# Altium schematic sheet Sheet1.SchDoc
size E; SheetNumber: 1; SheetTotal: 2
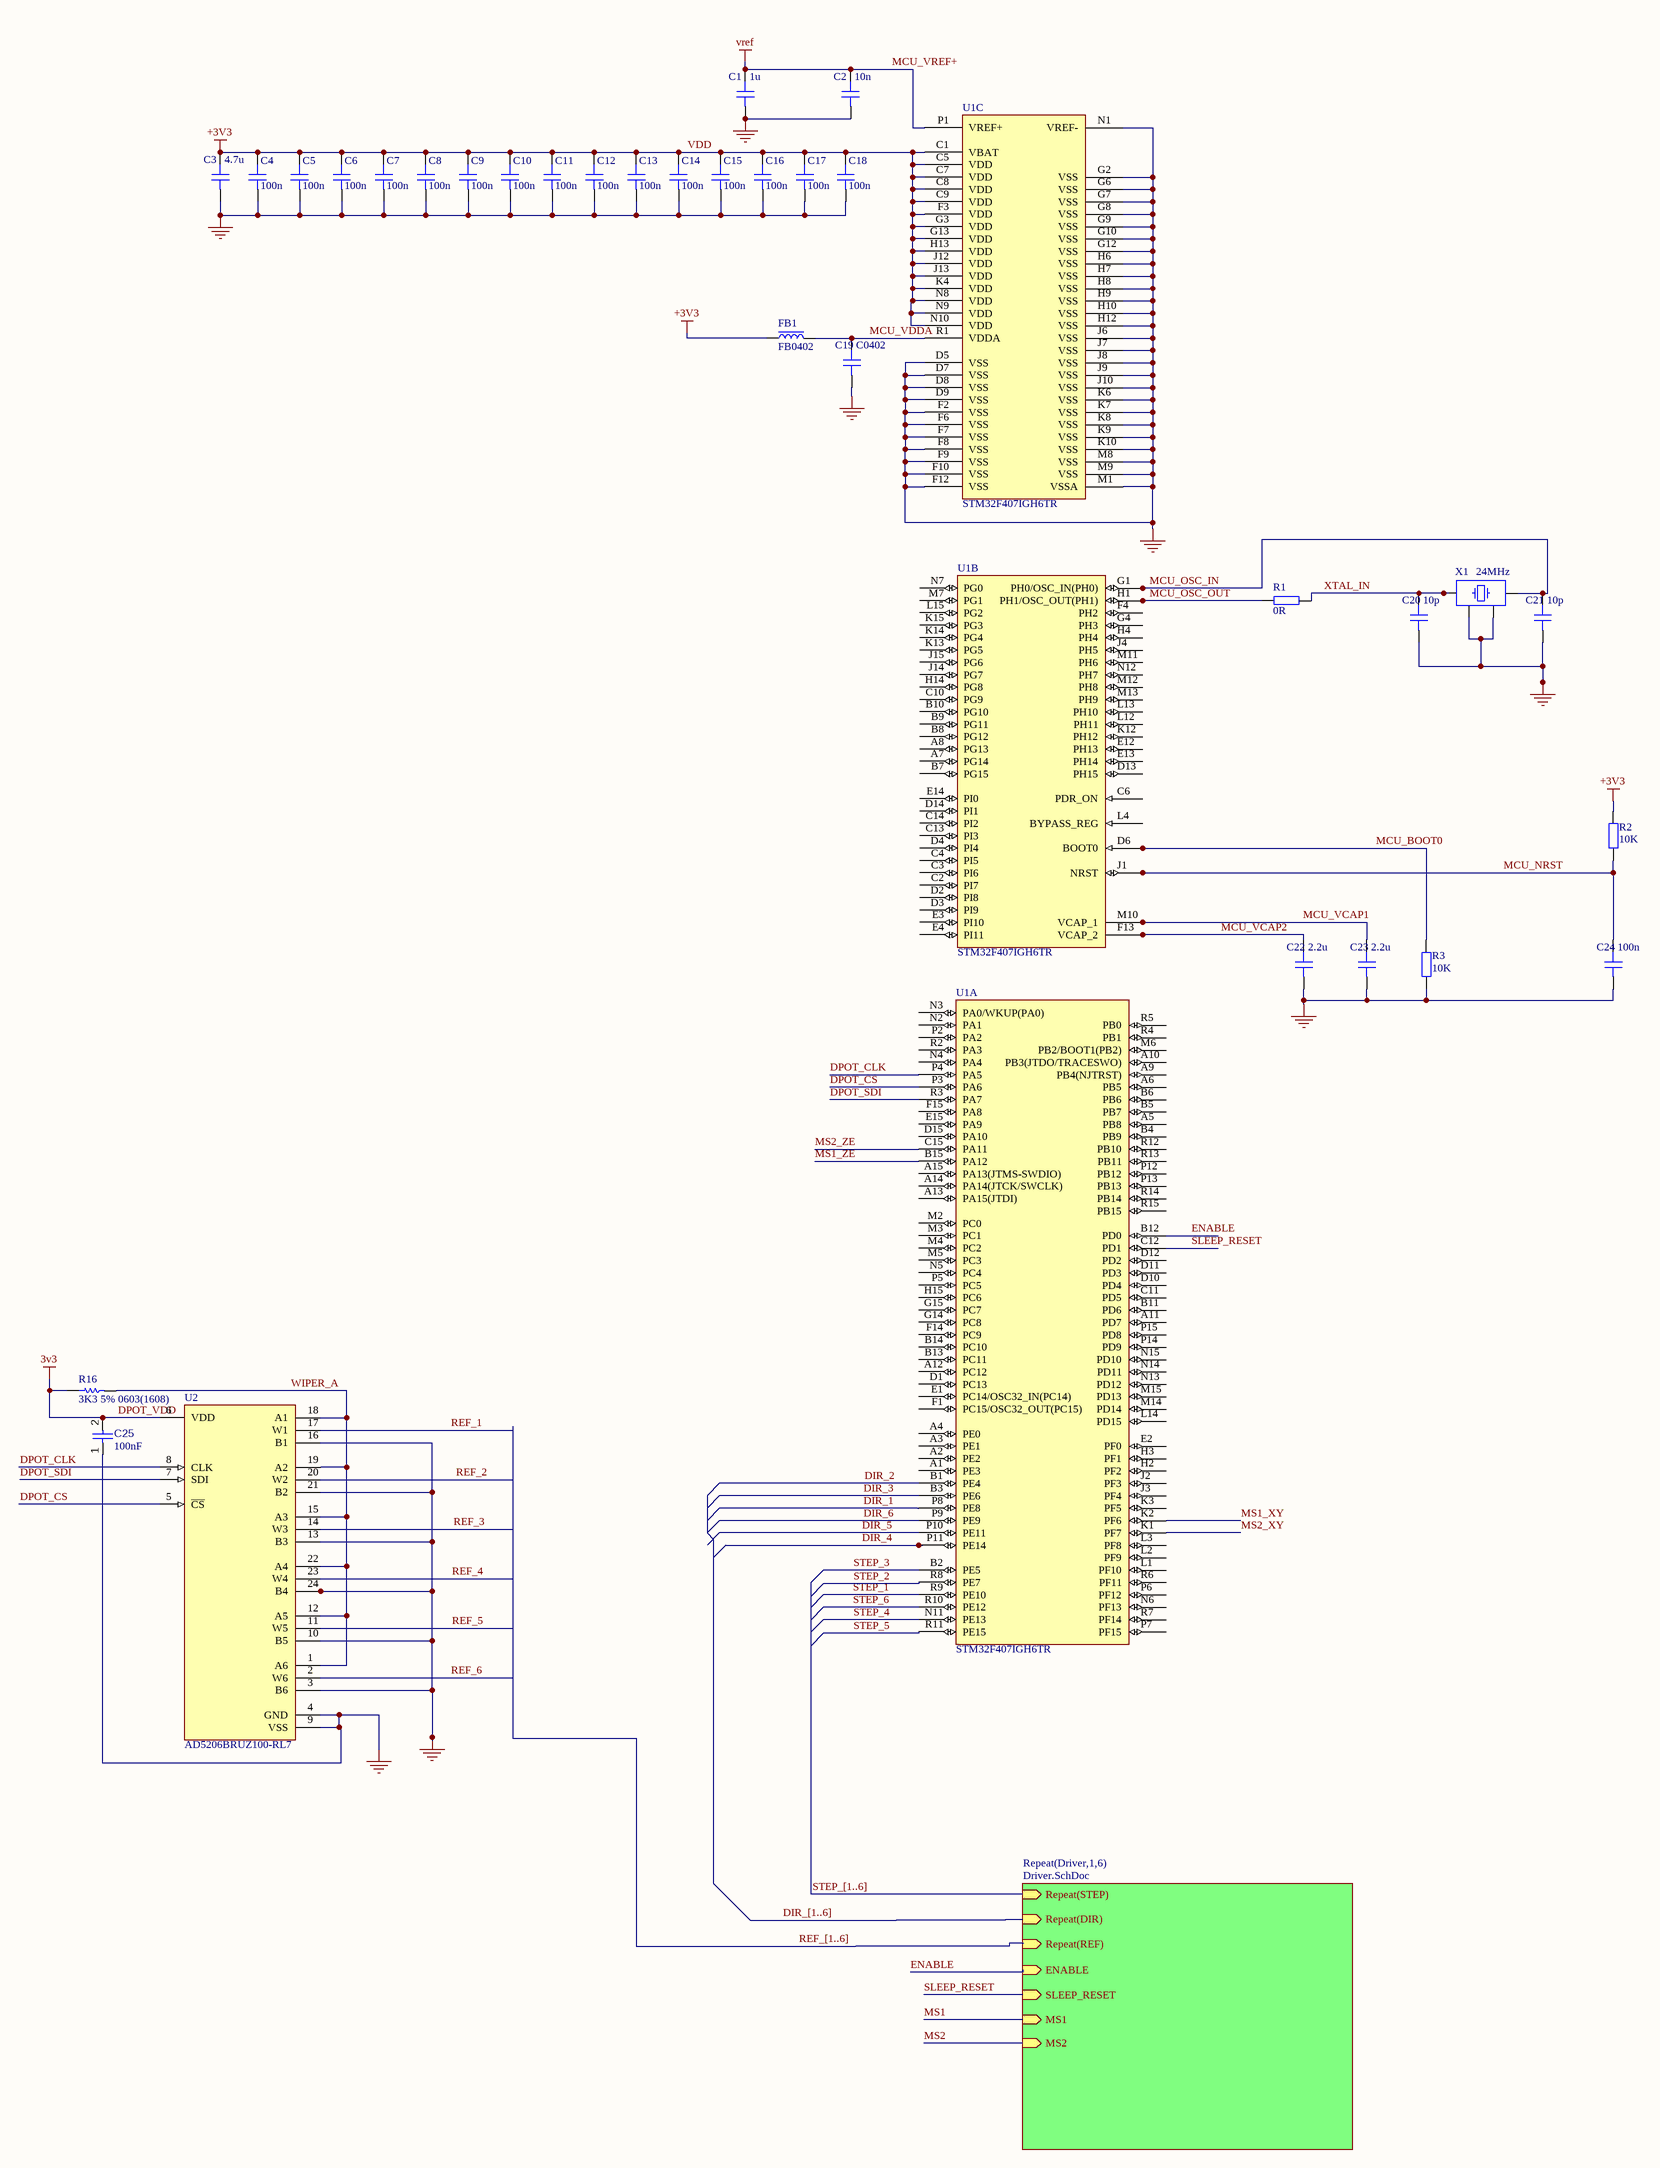
[diagram p0: Sheet1.SchDoc]

## Parts
C1  1u  [CAP_0402]
C2  10n  [CAP_0402]
C3  4.7u  [CAP_0402]
C4  100n  [CAP_0402]
C5  100n  [CAP_0402]
C6  100n  [CAP_0402]
C7  100n  [CAP_0402]
C8  100n  [CAP_0402]
C9  100n  [CAP_0402]
C10  100n  [CAP_0402]
C11  100n  [CAP_0402]
C12  100n  [CAP_0402]
C13  100n  [CAP_0402]
C14  100n  [CAP_0402]
C15  100n  [CAP_0402]
C16  100n  [CAP_0402]
C17  100n  [CAP_0402]
C18  100n  [CAP_0402]
C19  C0402  [CAP_0402]
C20  10p  [CAP_0402]
C21  10p  [CAP_0402]
C22  2.2u  [CAP_0402]
C23  2.2u  [CAP_0402]
C24  100n  [CAP_0402]
C25  value 100nF  [CAPC1608X90X40NL10T20]  (hidden comment: Capacitor 100 nF +/-10% 50 V 0603)
FB1  FB0402  [FB_0402]
R1  0R  [RES_0402]
R2  10K  [RES_0402]
R3  10K  [RES_0402]
R16  3K3 5% 0603(1608)  [RESC0603(1608)_N]
U1  STM32F407IGH6TR  [STM-UFBGA176+25_A_V]  (parts A,B,C of 3)
U2  AD5206BRUZ100-RL7  [FP-RU-24-IPC_C]
X1  24MHz  [XTAL_3225]

## Sub-sheets
Repeat(Driver,1,6) = Driver.SchDoc: ENABLE (in), SLEEP_RESET (in), MS1 (in), MS2 (in), Repeat(REF) (in), Repeat(DIR) (in), Repeat(STEP) (in)

## Nets
DPOT_VDD: C25.2 R16.1 U2.6(VDD)  [also labelled 3v3]
GND: C1.1 C2.1 C3.1 C4.1 C5.1 C6.1 C7.1 C8.1 C9.1 C10.1 C11.1 C12.1 C13.1 C14.1 C15.1 C16.1 C17.1 C18.1 C19.1 C20.1 C21.1 C22.1 C23.1 C24.1 C25.1 R3.2 U1.D5(VSS) U1.D7(VSS) U1.D8(VSS) U1.D9(VSS) U1.F2(VSS) U1.F6(VSS) U1.F7(VSS) U1.F8(VSS) U1.F9(VSS) U1.F10(VSS) U1.F12(VSS) U1.G2(VSS) U1.G6(VSS) U1.G7(VSS) U1.G8(VSS) U1.G9(VSS) U1.G10(VSS) U1.G12(VSS) U1.H6(VSS) U1.H7(VSS) U1.H8(VSS) U1.H9(VSS) U1.H10(VSS) U1.H12(VSS) U1.J6(VSS) U1.J7(VSS) U1.J8(VSS) U1.J9(VSS) U1.J10(VSS) U1.K6(VSS) U1.K7(VSS) U1.K8(VSS) U1.K9(VSS) U1.K10(VSS) U1.M1(VSSA) U1.M8(VSS) U1.M9(VSS) U1.N1(VREF-) U2.3(B6) U2.4(GND) U2.9(VSS) U2.10(B5) U2.13(B3) U2.16(B1) U2.21(B2) U2.24(B4) X1.2 X1.4
MCU_VREF+: C1.2 C2.2 U1.P1(VREF+)  [also labelled vref]
VDD: C3.2 C4.2 C5.2 C6.2 C7.2 C8.2 C9.2 C10.2 C11.2 C12.2 C13.2 C14.2 C15.2 C16.2 C17.2 C18.2 FB1.1 R2.1 U1.C1(VBAT) U1.C5(VDD) U1.C7(VDD) U1.C8(VDD) U1.C9(VDD) U1.F3(VDD) U1.G3(VDD) U1.G13(VDD) U1.H13(VDD) U1.J12(VDD) U1.J13(VDD) U1.K4(VDD) U1.N8(VDD) U1.N9(VDD) U1.N10(VDD)  [also labelled +3V3]
DIR_1: U1.P8(PE8)
DIR_2: U1.B1(PE4)
DIR_3: U1.B3(PE6)
DIR_4: U1.P11(PE14)
DIR_5: U1.P10(PE11)
DIR_6: U1.P9(PE9)
DPOT_CLK: U1.P4(PA5) U2.8(CLK)
DPOT_CS: U1.P3(PA6) U2.5(~{CS})
DPOT_SDI: U1.R3(PA7) U2.7(SDI)
ENABLE: U1.B12(PD0) ; sheet Repeat(Driver,1,6)/ENABLE
MCU_BOOT0: R3.1 U1.D6(BOOT0)
MCU_NRST: C24.2 R2.2 U1.J1(NRST)
MCU_OSC_IN: C21.2 U1.G1(PH0/OSC_IN(PH0)) X1.3
MCU_OSC_OUT: R1.2 U1.H1(PH1/OSC_OUT(PH1))
MCU_VCAP1: C23.2 U1.M10(VCAP_1)
MCU_VCAP2: C22.2 U1.F13(VCAP_2)
MCU_VDDA: C19.2 FB1.2 U1.R1(VDDA)
MS1: sheet Repeat(Driver,1,6)/MS1
MS1_XY: U1.K2(PF6)
MS1_ZE: U1.B15(PA12)
MS2: sheet Repeat(Driver,1,6)/MS2
MS2_XY: U1.K1(PF7)
MS2_ZE: U1.C15(PA11)
REF_1: U2.17(W1)
REF_2: U2.20(W2)
REF_3: U2.14(W3)
REF_4: U2.23(W4)
REF_5: U2.11(W5)
REF_6: U2.2(W6)
SLEEP_RESET: U1.C12(PD1) ; sheet Repeat(Driver,1,6)/SLEEP_RESET
STEP_1: U1.R9(PE10)
STEP_2: U1.R8(PE7)
STEP_3: U1.B2(PE5)
STEP_4: U1.N11(PE13)
STEP_5: U1.R11(PE15)
STEP_6: U1.R10(PE12)
WIPER_A: R16.2 U2.1(A6) U2.12(A5) U2.15(A3) U2.18(A1) U2.19(A2) U2.22(A4)
XTAL_IN: C20.2 R1.1 X1.1

Not connected (* = marked no-connect by the designer): U1 A1(PE3) A2(PE2) A3(PE1) A4(PE0) A5(PB8) A6(PB5) A7(PG14) A8(PG13) A9(PB4(NJTRST)) A10(PB3(JTDO/TRACESWO)) A11(PD7) A12(PC12) A13(PA15(JTDI)) A14(PA14(JTCK/SWCLK)) A15(PA13(JTMS-SWDIO)) B4(PB9) B5(PB7) B6(PB6) B7(PG15) B8(PG12) B9(PG11) B10(PG10) B11(PD6) B13(PC11) B14(PC10) C2(PI7) C3(PI6) C4(PI5) C6(PDR_ON) C10(PG9) C11(PD5) C13(PI3) C14(PI2) D1(PC13) D2(PI8) D3(PI9) D4(PI4) D10(PD4) D11(PD3) D12(PD2) D13(PH15) D14(PI1) D15(PA10) E1(PC14/OSC32_IN(PC14)) E2(PF0) E3(PI10) E4(PI11) E12(PH13) E13(PH14) E14(PI0) E15(PA9) F1(PC15/OSC32_OUT(PC15)) F4(PH2) F14(PC9) F15(PA8) G4(PH3) G14(PC8) G15(PC7) H2(PF2) H3(PF1) H4(PH4) H14(PG8) H15(PC6) J2(PF3) J3(PF4) J4(PH5) J14(PG7) J15(PG6) K3(PF5) K12(PH12) K13(PG5) K14(PG4) K15(PG3) L1(PF10) L2(PF9) L3(PF8) L4(BYPASS_REG) L12(PH11) L13(PH10) L14(PD15) L15(PG2) M2(PC0) M3(PC1) M4(PC2) M5(PC3) M6(PB2/BOOT1(PB2)) M7(PG1) M11(PH6) M12(PH8) M13(PH9) M14(PD14) M15(PD13) N2(PA1) N3(PA0/WKUP(PA0)) N4(PA4) N5(PC4) N6(PF13) N7(PG0) N12(PH7) N13(PD12) N14(PD11) N15(PD10) P2(PA2) P5(PC5) P6(PF12) P7(PF15) P12(PB12) P13(PB13) P14(PD9) P15(PD8) R2(PA3) R4(PB1) R5(PB0) R6(PF11) R7(PF14) R12(PB10) R13(PB11) R14(PB14) R15(PB15)

## Buses and harness runs
bus DIR_[1..6]
bus REF_[1..6]
bus STEP_[1..6]

## Library data of the parts
C1-C24 = CAP_0402: Capacitor SMD 0402; Manufacturer: *; Manufacturer Part Number: *; Distributor Link: *; LCSC: *; Rating: *; Dielectric: *
C25 = CMP-001-00017-6: Chip Capacitor, 100 nF, +/- 10%, 50 V, 0603 (1608 Metric); Voltage Rating: 50V; Capacitor Type: Ceramic; Tolerance: 10%; Mounting Technology: SM; Max Operating Temperature: 125°C; RoHS Compliant: True; Pins: 2; Case/Package: 0603; Min Operating Temperature: -55°C
FB1 = FB_0402: Ferrite Bead SMD 0402; Manufacturer: *; Manufacturer Part Number: *; Distributor Link: *; LCSC: *
R1-R3 = RES_0402: Resistor SMD 0402; Manufacturer: *; Manufacturer Part Number: *; Distributor Link: *; LCSC: *
R16 = CMP-1012-00086-1: 3K3 0.1W 5% 0603 (1608 Metric)  SMD; Case-EIA: 0603; Value: 3300.00 Ohm; Case-Metric: 1608; Technology: SMT; Tolerance: 5 %; Power: 0.1 W
U1 = CMP-020-00024-1: MCU 32-bit ARM Cortex M4 RISC 1MB Flash 2.5V/3.3V 201-Pin UFBGA T/R; Interface: CAN, EBI/EMI, Ethernet, I2C, IrDA, LIN, SPI, UART, USART, USB; Clock Frequency: 26MHz; Frequency: 168MHz; RAM Size: 196kB; Max Supply Voltage: 3.6V; Min Supply Voltage: 1.8V; Min Operating Temperature: -40°C; Max Operating Temperature: 85°C
U2 = CMP-09083-000058-1: IC DGT POT 100KOHM 256TP 24TSSOP; Number of Positions: 256; Supply Current: 12uA; Memory Type: Volatile; Interface: SPI; Max Dual Supply Voltage: 2.7V; Dual Supply Voltage: 2.5V; Number of Elements: 6; Resistance Tolerance: 30%; -3db Bandwidth: 721kHz; Min Dual Supply Voltage: 2.3V; Resistance: 100kR; Temperature Coefficient: 700ppm/°C; Max Supply Voltage: 5.5V; REACH SVHC: No SVHC; Taper: Linear; RoHS Compliant: Yes; Contact Plating: Tin; Operating Supply Current: 12uA; Min Operating Temperature: -40°C; Nominal Supply Current: 12uA; Quiescent Current: 12uA; Number of Taps: 256; Package Quantity: 1000; Mount: Surface Mount; Number of Pins: 24; Number of Circuits: 6; Tolerance: 30%; Case/Package: TSSOP; Series: -; Min Supply Voltage: 2.7V; Packaging: Tape and Reel; Lead Free: Contains Lead; Max Supply Current: 12uA; Max Operating Temperature: 85°C
X1 = TSX-3225_24.0000MF15X-AC: Crystal SMD 24MHz 10PPM 7pF 3225; Manufacturer: Epson; Manufacturer Part Number: TSX-3225 24.0000MF15X-AC